# Altium project DanielFairbanksPCB_18_3_6.PrjPcb
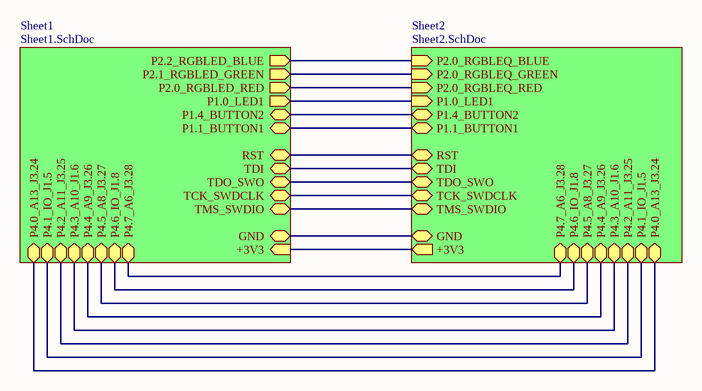
[diagram p0: Sheet3.SchDoc]
3 sheets, 57 parts. Net scope: hierarchical (ports join the sheet entries above them; power ports are global).
Board file: PCB1.PcbDoc
Sheets:
  Sheet3.SchDoc
    Sheet1 = Sheet1.SchDoc
    Sheet2 = Sheet2.SchDoc

## Sheet Sheet3.SchDoc
size A

### Sub-sheets
Sheet1 = Sheet1.SchDoc: +3V3 (in), GND, P1.1_BUTTON1, P1.4_BUTTON2, RST, P1.0_LED1 (out), P2.0_RGBLED_RED (out), P2.2_RGBLED_BLUE (out), P2.1_RGBLED_GREEN (out), TDI, TDO_SWO, TCK_SWDCLK, TMS_SWDIO, P4.1_IO_J1.5, P4.2_A11_J3.25, P4.3_A10_J1.6, P4.4_A9_J3.26, P4.5_A8_J3.27, P4.6_IO_J1.8, P4.0_A13_J3.24, P4.7_A6_J3.28
Sheet2 = Sheet2.SchDoc: +3V3 (out), GND, P1.1_BUTTON1, P1.4_BUTTON2, RST, P1.0_LED1 (in), P2.0_RGBLEQ_RED (in), P2.0_RGBLEQ_GREEN (in), P2.0_RGBLEQ_BLUE (in), TDI, TDO_SWO, TCK_SWDCLK, TMS_SWDIO, P4.0_A13_J3.24, P4.1_IO_J1.5, P4.2_A11_J3.25, P4.3_A10_J1.6, P4.4_A9_J3.26, P4.5_A8_J3.27, P4.6_IO_J1.8, P4.7_A6_J3.28

### Nets
GND: sheet Sheet1/GND, sheet Sheet2/GND
+3V3: sheet Sheet1/+3V3, sheet Sheet2/+3V3
P1.0_LED1: sheet Sheet1/P1.0_LED1, sheet Sheet2/P1.0_LED1
P1.1_BUTTON1: sheet Sheet1/P1.1_BUTTON1, sheet Sheet2/P1.1_BUTTON1
P1.4_BUTTON2: sheet Sheet1/P1.4_BUTTON2, sheet Sheet2/P1.4_BUTTON2
P2.0_RGBLED_RED: sheet Sheet1/P2.0_RGBLED_RED, sheet Sheet2/P2.0_RGBLEQ_RED
P2.0_RGBLEQ_BLUE: sheet Sheet1/P2.2_RGBLED_BLUE, sheet Sheet2/P2.0_RGBLEQ_BLUE
P2.0_RGBLEQ_GREEN: sheet Sheet1/P2.1_RGBLED_GREEN, sheet Sheet2/P2.0_RGBLEQ_GREEN
P4.0_A13_J3.24: sheet Sheet1/P4.0_A13_J3.24, sheet Sheet2/P4.0_A13_J3.24
P4.1_IO_J1.5: sheet Sheet1/P4.1_IO_J1.5, sheet Sheet2/P4.1_IO_J1.5
P4.2_A11_J3.25: sheet Sheet1/P4.2_A11_J3.25, sheet Sheet2/P4.2_A11_J3.25
P4.3_A10_J1.6: sheet Sheet1/P4.3_A10_J1.6, sheet Sheet2/P4.3_A10_J1.6
P4.4_A9_J3.26: sheet Sheet1/P4.4_A9_J3.26, sheet Sheet2/P4.4_A9_J3.26
P4.5_A8_J3.27: sheet Sheet1/P4.5_A8_J3.27, sheet Sheet2/P4.5_A8_J3.27
P4.6_IO_J1.8: sheet Sheet1/P4.6_IO_J1.8, sheet Sheet2/P4.6_IO_J1.8
P4.7_A6_J3.28: sheet Sheet1/P4.7_A6_J3.28, sheet Sheet2/P4.7_A6_J3.28
RST: sheet Sheet1/RST, sheet Sheet2/RST
TDI: sheet Sheet1/TDI, sheet Sheet2/TDI
TDO_SWO: sheet Sheet1/TDO_SWO, sheet Sheet2/TDO_SWO
TMS_SWDIO: sheet Sheet1/TMS_SWDIO, sheet Sheet2/TMS_SWDIO
NetJ10_4: sheet Sheet1/TCK_SWDCLK, sheet Sheet2/TCK_SWDCLK

## Sheet Sheet1.SchDoc
size A
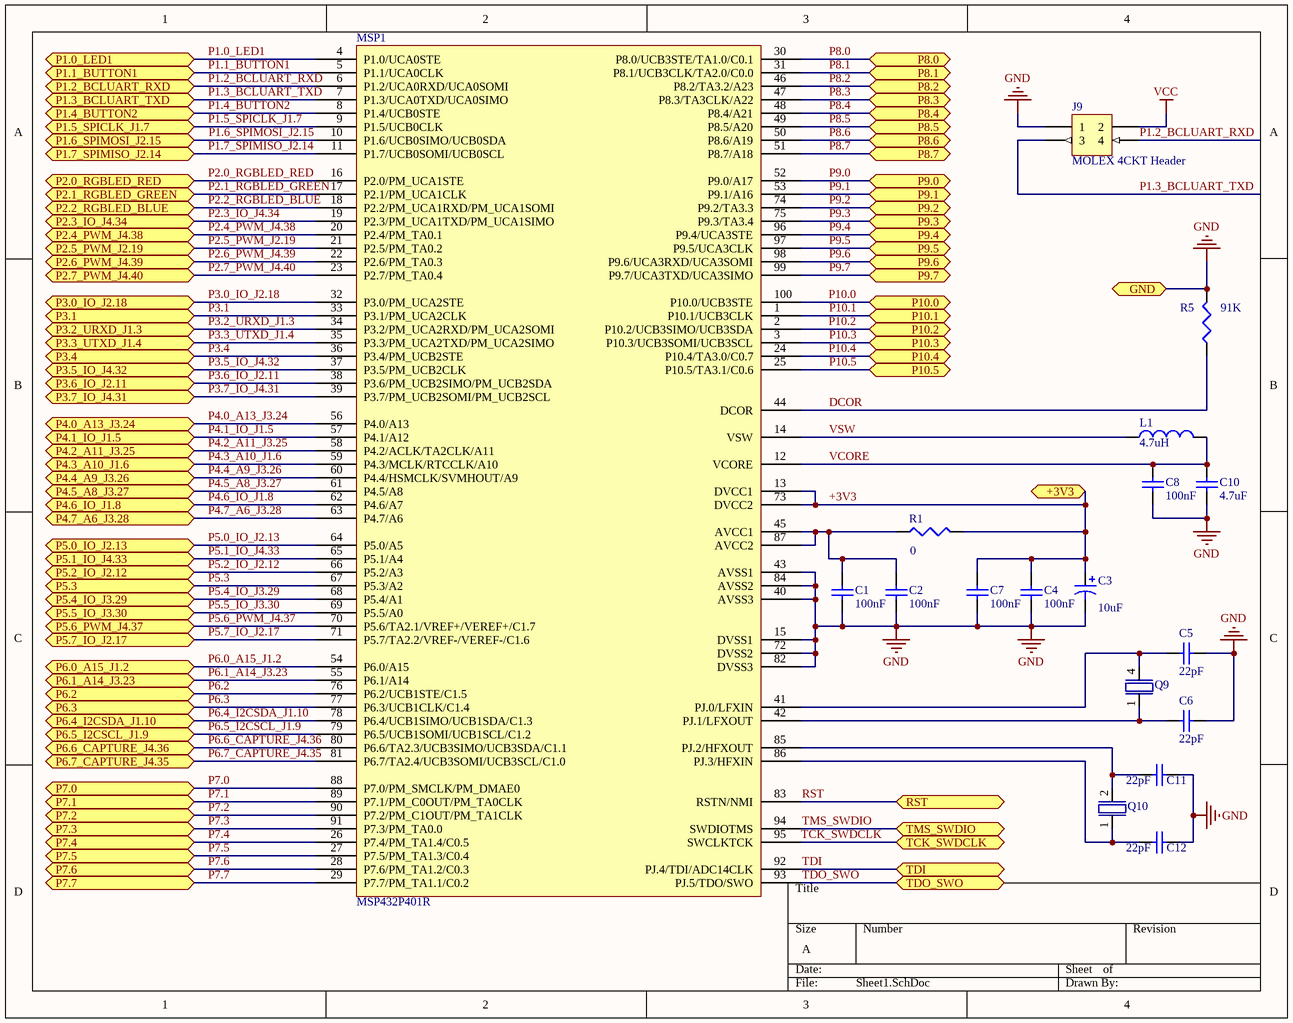
[diagram p1: Sheet1.SchDoc]

### Parts
C1  value 100nF  [0402]  (hidden comment: Cap Semi)
C2  value 100nF  [0402]  (hidden comment: Cap Semi)
C3  value 10uF  [C0805]  (hidden comment: Cap Pol3)
C4  value 100nF  [0402]  (hidden comment: Cap Semi)
C5  value 22pF  [0402]  (hidden comment: Cap Semi)
C6  value 22pF  [0402]  (hidden comment: Cap Semi)
C7  value 100nF  [0402]  (hidden comment: Cap Semi)
C8  value 100nF  [0402]  (hidden comment: Cap Semi)
C10  value 4.7uF  [0402]  (hidden comment: Cap Semi)
C11  value 22pF  [0402]  (hidden comment: Cap Semi)
C12  value 22pF  [0402]  (hidden comment: Cap Semi)
J9  MOLEX 4CKT Header  [MOLEX 4CKT Header]
L1  value 4.7uH  [0402-A]  (hidden comment: Inductor)
MSP1  MSP432P401R  [MSP432P401R]
Q9  Crystal Oscillator  [4-SOJ]  (value not drawn)
Q10  Crystal Oscillator  [HC-49/US]  (value not drawn)
R1  value 0  [J1-0603]  (hidden comment: Res3)
R5  value 91K  [J1-0603]  (hidden comment: Res3)

### Ports
+3V3, GND, P1.0_LED1, P1.1_BUTTON1, P1.2_BCLUART_RXD, P1.3_BCLUART_TXD, P1.4_BUTTON2, P1.5_SPICLK_J1.7, P1.6_SPIMOSI_J2.15, P1.7_SPIMISO_J2.14, P2.0_RGBLED_RED, P2.1_RGBLED_GREEN, P2.2_RGBLED_BLUE, P2.3_IO_J4.34, P2.4_PWM_J4.38, P2.5_PWM_J2.19, P2.6_PWM_J4.39, P2.7_PWM_J4.40, P3.0_IO_J2.18, P3.1, P3.2_URXD_J1.3, P3.3_UTXD_J1.4, P3.4, P3.5_IO_J4.32, P3.6_IO_J2.11, P3.7_IO_J4.31, P4.0_A13_J3.24, P4.1_IO_J1.5, P4.2_A11_J3.25, P4.3_A10_J1.6, P4.4_A9_J3.26, P4.5_A8_J3.27, P4.6_IO_J1.8, P4.7_A6_J3.28, P5.0_IO_J2.13, P5.1_IO_J4.33, P5.2_IO_J2.12, P5.3, P5.4_IO_J3.29, P5.5_IO_J3.30, P5.6_PWM_J4.37, P5.7_IO_J2.17, P6.0_A15_J1.2, P6.1_A14_J3.23, P6.2, P6.3, P6.4_I2CSDA_J1.10, P6.5_I2CSCL_J1.9, P6.6_CAPTURE_J4.36, P6.7_CAPTURE_J4.35, P7.0, P7.1, P7.2, P7.3, P7.4, P7.5, P7.6, P7.7, P8.0, P8.1, P8.2, P8.3, P8.4, P8.5, P8.6, P8.7, P9.0, P9.1, P9.2, P9.3, P9.4, P9.5, P9.6, P9.7, P10.0, P10.1, P10.2, P10.3, P10.4, P10.5, RST, TCK_SWDCLK, TDI, TDO_SWO, TMS_SWDIO

### Nets
GND: C1.1 C2.1 C3.2 C4.1 C5.1 C6.1 C7.1 C8.1 C10.1 C11.1 C12.1 J9.1 MSP1.15(DVSS1) MSP1.40(AVSS3) MSP1.43(AVSS1) MSP1.72(DVSS2) MSP1.82(DVSS3) MSP1.84(AVSS2) R5.2 ; port GND
VCC: J9.2
+3V3: C3.1 C4.2 C7.2 MSP1.13(DVCC1) MSP1.73(DVCC2) R1.2 ; port +3V3
DCOR: MSP1.44(DCOR) R5.1
P1.0_LED1: MSP1.4(P1.0/UCA0STE) ; port P1.0_LED1
P1.1_BUTTON1: MSP1.5(P1.1/UCA0CLK) ; port P1.1_BUTTON1
P1.2_BCLUART_RXD: J9.4 MSP1.6(P1.2/UCA0RXD/UCA0SOMI) ; port P1.2_BCLUART_RXD
P1.3_BCLUART_TXD: J9.3 MSP1.7(P1.3/UCA0TXD/UCA0SIMO) ; port P1.3_BCLUART_TXD
P1.4_BUTTON2: MSP1.8(P1.4/UCB0STE) ; port P1.4_BUTTON2
P1.5_SPICLK_J1.7: MSP1.9(P1.5/UCB0CLK) ; port P1.5_SPICLK_J1.7
P1.6_SPIMOSI_J2.15: MSP1.10(P1.6/UCB0SIMO/UCB0SDA) ; port P1.6_SPIMOSI_J2.15
P1.7_SPIMISO_J2.14: MSP1.11(P1.7/UCB0SOMI/UCB0SCL) ; port P1.7_SPIMISO_J2.14
P2.0_RGBLED_RED: MSP1.16(P2.0/PM_UCA1STE) ; port P2.0_RGBLED_RED
P2.1_RGBLED_GREEN: MSP1.17(P2.1/PM_UCA1CLK) ; port P2.1_RGBLED_GREEN  [project net P2.0_RGBLEQ_GREEN]
P2.2_RGBLED_BLUE: MSP1.18(P2.2/PM_UCA1RXD/PM_UCA1SOMI) ; port P2.2_RGBLED_BLUE  [project net P2.0_RGBLEQ_BLUE]
P2.3_IO_J4.34: MSP1.19(P2.3/PM_UCA1TXD/PM_UCA1SIMO) ; port P2.3_IO_J4.34
P2.4_PWM_J4.38: MSP1.20(P2.4/PM_TA0.1) ; port P2.4_PWM_J4.38
P2.5_PWM_J2.19: MSP1.21(P2.5/PM_TA0.2) ; port P2.5_PWM_J2.19
P2.6_PWM_J4.39: MSP1.22(P2.6/PM_TA0.3) ; port P2.6_PWM_J4.39
P2.7_PWM_J4.40: MSP1.23(P2.7/PM_TA0.4) ; port P2.7_PWM_J4.40
P3.0_IO_J2.18: MSP1.32(P3.0/PM_UCA2STE) ; port P3.0_IO_J2.18
P3.1: MSP1.33(P3.1/PM_UCA2CLK) ; port P3.1
P3.2_URXD_J1.3: MSP1.34(P3.2/PM_UCA2RXD/PM_UCA2SOMI) ; port P3.2_URXD_J1.3
P3.3_UTXD_J1.4: MSP1.35(P3.3/PM_UCA2TXD/PM_UCA2SIMO) ; port P3.3_UTXD_J1.4
P3.4: MSP1.36(P3.4/PM_UCB2STE) ; port P3.4
P3.5_IO_J4.32: MSP1.37(P3.5/PM_UCB2CLK) ; port P3.5_IO_J4.32
P3.6_IO_J2.11: MSP1.38(P3.6/PM_UCB2SIMO/PM_UCB2SDA) ; port P3.6_IO_J2.11
P3.7_IO_J4.31: MSP1.39(P3.7/PM_UCB2SOMI/PM_UCB2SCL) ; port P3.7_IO_J4.31
P4.0_A13_J3.24: MSP1.56(P4.0/A13) ; port P4.0_A13_J3.24
P4.1_IO_J1.5: MSP1.57(P4.1/A12) ; port P4.1_IO_J1.5
P4.2_A11_J3.25: MSP1.58(P4.2/ACLK/TA2CLK/A11) ; port P4.2_A11_J3.25
P4.3_A10_J1.6: MSP1.59(P4.3/MCLK/RTCCLK/A10) ; port P4.3_A10_J1.6
P4.4_A9_J3.26: MSP1.60(P4.4/HSMCLK/SVMHOUT/A9) ; port P4.4_A9_J3.26
P4.5_A8_J3.27: MSP1.61(P4.5/A8) ; port P4.5_A8_J3.27
P4.6_IO_J1.8: MSP1.62(P4.6/A7) ; port P4.6_IO_J1.8
P4.7_A6_J3.28: MSP1.63(P4.7/A6) ; port P4.7_A6_J3.28
P5.0_IO_J2.13: MSP1.64(P5.0/A5) ; port P5.0_IO_J2.13
P5.1_IO_J4.33: MSP1.65(P5.1/A4) ; port P5.1_IO_J4.33
P5.2_IO_J2.12: MSP1.66(P5.2/A3) ; port P5.2_IO_J2.12
P5.3: MSP1.67(P5.3/A2) ; port P5.3
P5.4_IO_J3.29: MSP1.68(P5.4/A1) ; port P5.4_IO_J3.29
P5.5_IO_J3.30: MSP1.69(P5.5/A0) ; port P5.5_IO_J3.30
P5.6_PWM_J4.37: MSP1.70(P5.6/TA2.1/VREF+/VEREF+/C1.7) ; port P5.6_PWM_J4.37
P5.7_IO_J2.17: MSP1.71(P5.7/TA2.2/VREF-/VEREF-/C1.6) ; port P5.7_IO_J2.17
P6.0_A15_J1.2: MSP1.54(P6.0/A15) ; port P6.0_A15_J1.2
P6.1_A14_J3.23: MSP1.55(P6.1/A14) ; port P6.1_A14_J3.23
P6.2: MSP1.76(P6.2/UCB1STE/C1.5) ; port P6.2
P6.3: MSP1.77(P6.3/UCB1CLK/C1.4) ; port P6.3
P6.4_I2CSDA_J1.10: MSP1.78(P6.4/UCB1SIMO/UCB1SDA/C1.3) ; port P6.4_I2CSDA_J1.10
P6.5_I2CSCL_J1.9: MSP1.79(P6.5/UCB1SOMI/UCB1SCL/C1.2) ; port P6.5_I2CSCL_J1.9
P6.6_CAPTURE_J4.36: MSP1.80(P6.6/TA2.3/UCB3SIMO/UCB3SDA/C1.1) ; port P6.6_CAPTURE_J4.36
P6.7_CAPTURE_J4.35: MSP1.81(P6.7/TA2.4/UCB3SOMI/UCB3SCL/C1.0) ; port P6.7_CAPTURE_J4.35
P7.0: MSP1.88(P7.0/PM_SMCLK/PM_DMAE0) ; port P7.0
P7.1: MSP1.89(P7.1/PM_C0OUT/PM_TA0CLK) ; port P7.1
P7.2: MSP1.90(P7.2/PM_C1OUT/PM_TA1CLK) ; port P7.2
P7.3: MSP1.91(P7.3/PM_TA0.0) ; port P7.3
P7.4: MSP1.26(P7.4/PM_TA1.4/C0.5) ; port P7.4
P7.5: MSP1.27(P7.5/PM_TA1.3/C0.4) ; port P7.5
P7.6: MSP1.28(P7.6/PM_TA1.2/C0.3) ; port P7.6
P7.7: MSP1.29(P7.7/PM_TA1.1/C0.2) ; port P7.7
P8.0: MSP1.30(P8.0/UCB3STE/TA1.0/C0.1) ; port P8.0
P8.1: MSP1.31(P8.1/UCB3CLK/TA2.0/C0.0) ; port P8.1
P8.2: MSP1.46(P8.2/TA3.2/A23) ; port P8.2
P8.3: MSP1.47(P8.3/TA3CLK/A22) ; port P8.3
P8.4: MSP1.48(P8.4/A21) ; port P8.4
P8.5: MSP1.49(P8.5/A20) ; port P8.5
P8.6: MSP1.50(P8.6/A19) ; port P8.6
P8.7: MSP1.51(P8.7/A18) ; port P8.7
P9.0: MSP1.52(P9.0/A17) ; port P9.0
P9.1: MSP1.53(P9.1/A16) ; port P9.1
P9.2: MSP1.74(P9.2/TA3.3) ; port P9.2
P9.3: MSP1.75(P9.3/TA3.4) ; port P9.3
P9.4: MSP1.96(P9.4/UCA3STE) ; port P9.4
P9.5: MSP1.97(P9.5/UCA3CLK) ; port P9.5
P9.6: MSP1.98(P9.6/UCA3RXD/UCA3SOMI) ; port P9.6
P9.7: MSP1.99(P9.7/UCA3TXD/UCA3SIMO) ; port P9.7
P10.0: MSP1.100(P10.0/UCB3STE) ; port P10.0
P10.1: MSP1.1(P10.1/UCB3CLK) ; port P10.1
P10.2: MSP1.2(P10.2/UCB3SIMO/UCB3SDA) ; port P10.2
P10.3: MSP1.3(P10.3/UCB3SOMI/UCB3SCL) ; port P10.3
P10.4: MSP1.24(P10.4/TA3.0/C0.7) ; port P10.4
P10.5: MSP1.25(P10.5/TA3.1/C0.6) ; port P10.5
RST: MSP1.83(RSTN/NMI) ; port RST
TDI: MSP1.92(PJ.4/TDI/ADC14CLK) ; port TDI
TDO_SWO: MSP1.93(PJ.5/TDO/SWO) ; port TDO_SWO
TMS_SWDIO: MSP1.94(SWDIOTMS) ; port TMS_SWDIO
VCORE: C8.2 C10.2 L1.2 MSP1.12(VCORE)
VSW: L1.1 MSP1.14(VSW)
NetC1_2: C1.2 C2.2 MSP1.45(AVCC1) MSP1.87(AVCC2) R1.1
NetC5_2: C5.2 MSP1.41(PJ.0/LFXIN) Q9.4
NetC6_2: C6.2 MSP1.42(PJ.1/LFXOUT) Q9.1
NetC11_2: C11.2 MSP1.85(PJ.2/HFXOUT) Q10.2
NetC12_2: C12.2 MSP1.86(PJ.3/HFXIN) Q10.1
NetJ10_4: MSP1.95(SWCLKTCK) ; port TCK_SWDCLK

### Notes on the sheet
- Labels drawn without touching a wire or pin: TCK_SWDCLK

### Library data of the parts
C1 C2 C4-C8 C10-C12 = Cap Semi: Capacitor (Semiconductor SIM Model); Published: 8-Jun-2000; LatestRevisionDate: 29-May-2009; LatestRevisionNote: IPC-7351 Footprint Added.; PackageReference: C1206; Publisher: Altium Limited; PackageDescription: Chip Capacitor
C3 = Cap Pol3: Polarized Capacitor (Surface Mount); Published: 8-Jun-2000; LatestRevisionDate: 29-May-2009; LatestRevisionNote: IPC-7351 Footprint Added.; PackageReference: C0805; Publisher: Altium Limited; PackageDescription: Chip Capacitor
L1 = Inductor: Code_IEC: 1005; Published: 8-Jun-2000; LatestRevisionDate: 29-May-2009; LatestRevisionNote: IPC-7351 Footprint Added.; PackageReference: 0402-A; Publisher: Altium Limited; PackageDescription: Chip Inductor; Code_JEITA: 0402
R1 R5 = Res3: Resistor; Published: 8-Jun-2000; LatestRevisionDate: 29-May-2009; LatestRevisionNote: IPC-7351 Footprint Added.; PackageReference: J1-0603; Publisher: Altium Limited; PackageDescription: Chip Resistor

## Sheet Sheet2.SchDoc
size A
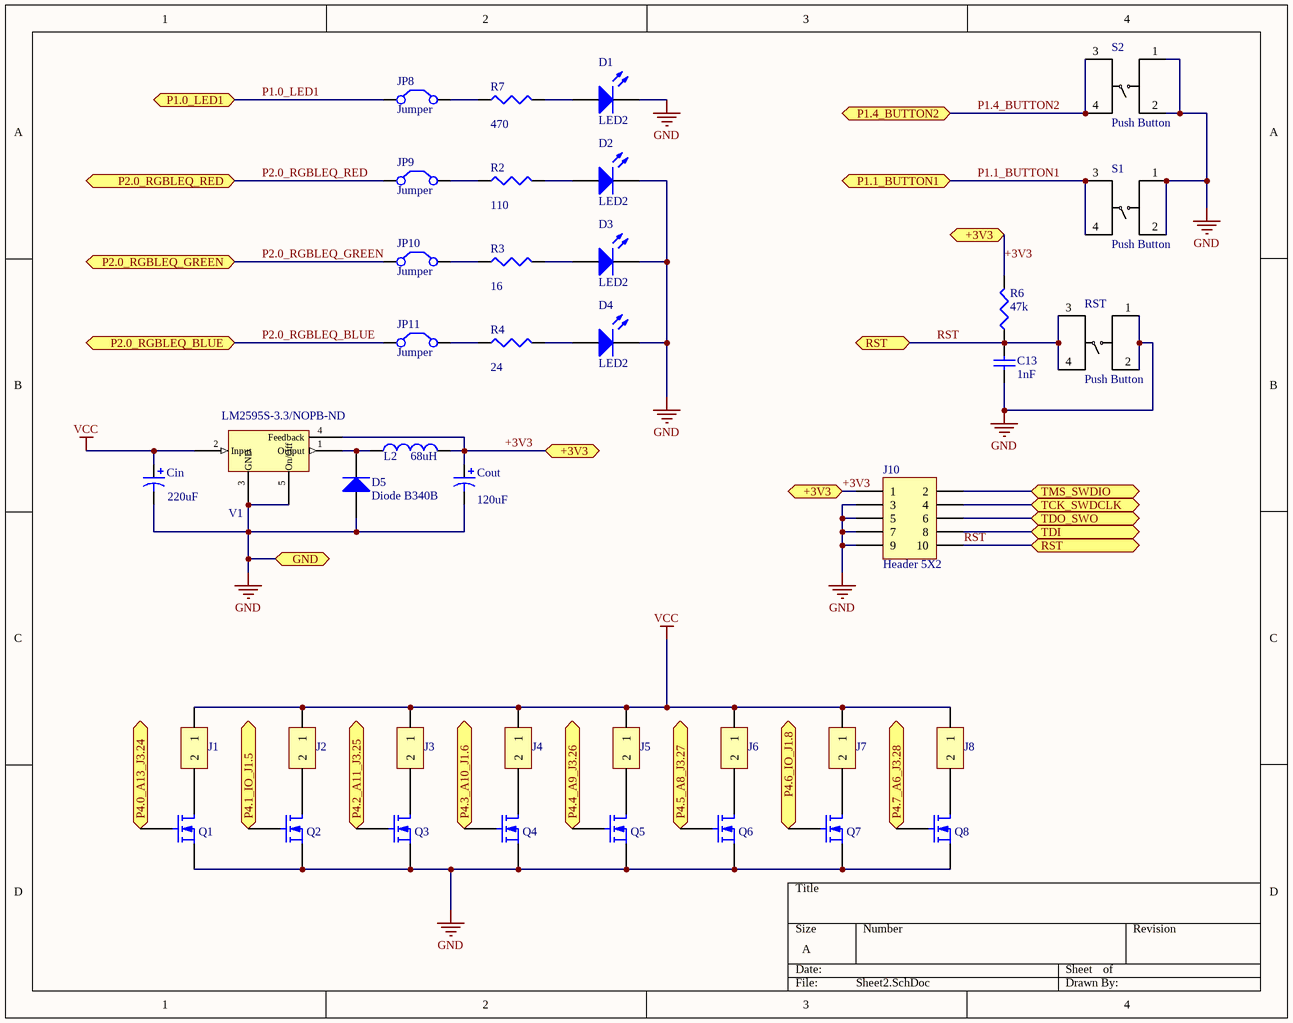
[diagram p2: Sheet2.SchDoc]

### Parts
C13  value 1nF  [0402]  (hidden comment: Cap Semi)
Cin  value 220uF  [C0805]  (hidden comment: Cap Pol3)
Cout  value 120uF  [C0805]  (hidden comment: Cap Pol3)
D1  LED2  [3.2X1.6X1.1]
D2  LED2  [3.2X1.6X1.1]
D3  LED2  [3.2X1.6X1.1]
D4  LED2  [3.2X1.6X1.1]
D5  Diode B340B  [SMB]
J1  MOLEX 2CKT Header  [MOLEX 2CKT Header]  (value not drawn)
J2  MOLEX 2CKT Header  [MOLEX 2CKT Header]  (value not drawn)
J3  MOLEX 2CKT Header  [MOLEX 2CKT Header]  (value not drawn)
J4  MOLEX 2CKT Header  [MOLEX 2CKT Header]  (value not drawn)
J5  MOLEX 2CKT Header  [MOLEX 2CKT Header]  (value not drawn)
J6  MOLEX 2CKT Header  [MOLEX 2CKT Header]  (value not drawn)
J7  MOLEX 2CKT Header  [MOLEX 2CKT Header]  (value not drawn)
J8  MOLEX 2CKT Header  [MOLEX 2CKT Header]  (value not drawn)
J10  Header 5X2  [HDR2X5]
JP8  Jumper  [HDR1X2]
JP9  Jumper  [HDR1X2]
JP10  Jumper  [HDR1X2]
JP11  Jumper  [HDR1X2]
L2  value 68uH  [0402-A]  (hidden comment: Inductor)
Q1  MOSFET-N  [SiUD41ED]  (value not drawn)
Q2  MOSFET-N  [SiUD41ED]  (value not drawn)
Q3  MOSFET-N  [SiUD41ED]  (value not drawn)
Q4  MOSFET-N  [SiUD41ED]  (value not drawn)
Q5  MOSFET-N  [SiUD41ED]  (value not drawn)
Q6  MOSFET-N  [SiUD41ED]  (value not drawn)
Q7  MOSFET-N  [SiUD41ED]  (value not drawn)
Q8  MOSFET-N  [SiUD41ED]  (value not drawn)
R2  value 110  [J1-0603]  (hidden comment: Res3)
R3  value 16  [J1-0603]  (hidden comment: Res3)
R4  value 24  [J1-0603]  (hidden comment: Res3)
R6  value 47k  [J1-0603]  (hidden comment: Res3)
R7  value 470  [J1-0603]  (hidden comment: Res3)
RST  Push Button  [Push Button]
S1  Push Button  [Push Button]
S2  Push Button  [Push Button]
V1  LM2595S-3.3/NOPB-ND  [LM2595S-3.3/NOPB-ND]

### Ports
+3V3, GND, P1.0_LED1, P1.1_BUTTON1, P1.4_BUTTON2, P2.0_RGBLEQ_BLUE, P2.0_RGBLEQ_GREEN, P2.0_RGBLEQ_RED, P4.0_A13_J3.24, P4.1_IO_J1.5, P4.2_A11_J3.25, P4.3_A10_J1.6, P4.4_A9_J3.26, P4.5_A8_J3.27, P4.6_IO_J1.8, P4.7_A6_J3.28, RST, TCK_SWDCLK, TDI, TDO_SWO, TMS_SWDIO

### Nets
GND: C13.1 Cin.2 Cout.2 D1.2(K) D2.2(K) D3.2(K) D4.2(K) D5.1(A) J10.3 J10.5 J10.7 J10.9 Q1.2 Q2.2 Q3.2 Q4.2 Q5.2 Q6.2 Q7.2 Q8.2 RST.1 RST.2 S1.1 S1.2 S2.1 S2.2 V1.3(GND) V1.5(On/Off) ; port GND
VCC: Cin.1 J1.1 J2.1 J3.1 J4.1 J5.1 J6.1 J7.1 J8.1 V1.2(Input)
+3V3: Cout.1 J10.1 L2.2 R6.2 V1.4(Feedback) ; port +3V3
P1.0_LED1: JP8.1(C1) ; port P1.0_LED1
P1.1_BUTTON1: S1.3 S1.4 ; port P1.1_BUTTON1
P1.4_BUTTON2: S2.3 S2.4 ; port P1.4_BUTTON2
P2.0_RGBLEQ_BLUE: JP11.1(C1) ; port P2.0_RGBLEQ_BLUE
P2.0_RGBLEQ_GREEN: JP10.1(C1) ; port P2.0_RGBLEQ_GREEN
P2.0_RGBLEQ_RED: JP9.1(C1) ; port P2.0_RGBLEQ_RED  [project net P2.0_RGBLED_RED]
P4.0_A13_J3.24: Q1.1 ; port P4.0_A13_J3.24
P4.1_IO_J1.5: Q2.1 ; port P4.1_IO_J1.5
P4.2_A11_J3.25: Q3.1 ; port P4.2_A11_J3.25
P4.3_A10_J1.6: Q4.1 ; port P4.3_A10_J1.6
P4.4_A9_J3.26: Q5.1 ; port P4.4_A9_J3.26
P4.5_A8_J3.27: Q6.1 ; port P4.5_A8_J3.27
P4.6_IO_J1.8: Q7.1 ; port P4.6_IO_J1.8
P4.7_A6_J3.28: Q8.1 ; port P4.7_A6_J3.28
RST: C13.2 J10.10 R6.1 RST.3 RST.4 ; port RST
TDI: J10.8 ; port TDI
TDO_SWO: J10.6 ; port TDO_SWO
TMS_SWDIO: J10.2 ; port TMS_SWDIO
NetD1_1: D1.1(A) R7.2
NetD2_1: D2.1(A) R2.2
NetD3_1: D3.1(A) R3.2
NetD4_1: D4.1(A) R4.2
NetD5_2: D5.2(K) L2.1 V1.1(Output)
NetJ1_2: J1.2 Q1.3
NetJ2_2: J2.2 Q2.3
NetJ3_2: J3.2 Q3.3
NetJ4_2: J4.2 Q4.3
NetJ5_2: J5.2 Q5.3
NetJ6_2: J6.2 Q6.3
NetJ7_2: J7.2 Q7.3
NetJ8_2: J8.2 Q8.3
NetJ10_4: J10.4 ; port TCK_SWDCLK
NetJP8_2: JP8.2(C2) R7.1
NetJP9_2: JP9.2(C2) R2.1
NetJP10_2: JP10.2(C2) R3.1
NetJP11_2: JP11.2(C2) R4.1

### Library data of the parts
C13 = Cap Semi: Capacitor (Semiconductor SIM Model); Published: 8-Jun-2000; LatestRevisionDate: 29-May-2009; LatestRevisionNote: IPC-7351 Footprint Added.; PackageReference: C1206; Publisher: Altium Limited; PackageDescription: Chip Capacitor
Cin Cout = Cap Pol3: Polarized Capacitor (Surface Mount); Published: 8-Jun-2000; LatestRevisionDate: 29-May-2009; LatestRevisionNote: IPC-7351 Footprint Added.; PackageReference: C0805; Publisher: Altium Limited; PackageDescription: Chip Capacitor
D1-D4 = LED2: Typical RED, GREEN, YELLOW, AMBER GaAs LED; Published: 8-Jun-2000; LatestRevisionDate: 17-Jul-2002; LatestRevisionNote: Re-released for DXP Platform.; PackageVersion: Feb-2002; PackageReference: 3.2X1.6X1.1; Publisher: Altium Limited; PackageDescription: SM LED; 2 Flat Leads
D5 = Diode: Default Diode; Published: 8-Jun-2000; LatestRevisionDate: 17-Jul-2002; LatestRevisionNote: Re-released for DXP Platform.; PackageVersion: Sep-1996; PackageReference: SMC; Publisher: Altium Limited; PackageDescription: DO-214-AB/SMC; 2 C-Bend Leads; Body 7.9 x 5.9 mm, inc. leads (LxW); Code_JEDEC: DO-214-AB
J10 = Header 5X2: Header, 5-Pin, Dual row; LatestRevisionDate: 17-Jul-2002; LatestRevisionNote: Re-released for DXP Platform.; Publisher: Altium Limited
JP8-JP11 = Jumper: Jumper Wire; Published: 24-Mar-1999; LatestRevisionDate: 17-Jul-2002; LatestRevisionNote: Re-released for DXP Platform.; PackageReference: RAD-0.2; Publisher: Altium Limited; PackageDescription: Radial Cap, Thru-Hole; 2 Leads; 0.2 in Pin Spacing
L2 = Inductor: Code_IEC: 1005; Published: 8-Jun-2000; LatestRevisionDate: 29-May-2009; LatestRevisionNote: IPC-7351 Footprint Added.; PackageReference: 0402-A; Publisher: Altium Limited; PackageDescription: Chip Inductor; Code_JEITA: 0402
Q1-Q8 = SiUD41ED
R2-R4 R6 R7 = Res3: Resistor; Published: 8-Jun-2000; LatestRevisionDate: 29-May-2009; LatestRevisionNote: IPC-7351 Footprint Added.; PackageReference: J1-0603; Publisher: Altium Limited; PackageDescription: Chip Resistor

## Nets that join several sheets
GND: Sheet1 (19 pins), Sheet2 (28 pins)
VCC: Sheet1 (J9.2), Sheet2 (10 pins)
+3V3: Sheet1 (6 pins), Sheet2 (5 pins)
NetJ10_4: Sheet1 (MSP1.95), Sheet2 (J10.4)
P1.0_LED1: Sheet1 (MSP1.4), Sheet2 (JP8.1)
P1.1_BUTTON1: Sheet1 (MSP1.5), Sheet2 (S1.3 S1.4)
P1.4_BUTTON2: Sheet1 (MSP1.8), Sheet2 (S2.3 S2.4)
P2.0_RGBLED_RED: Sheet1 (MSP1.16), Sheet2 (JP9.1)
P2.0_RGBLEQ_BLUE: Sheet1 (MSP1.18), Sheet2 (JP11.1)
P2.0_RGBLEQ_GREEN: Sheet1 (MSP1.17), Sheet2 (JP10.1)
P4.0_A13_J3.24: Sheet1 (MSP1.56), Sheet2 (Q1.1)
P4.1_IO_J1.5: Sheet1 (MSP1.57), Sheet2 (Q2.1)
P4.2_A11_J3.25: Sheet1 (MSP1.58), Sheet2 (Q3.1)
P4.3_A10_J1.6: Sheet1 (MSP1.59), Sheet2 (Q4.1)
P4.4_A9_J3.26: Sheet1 (MSP1.60), Sheet2 (Q5.1)
P4.5_A8_J3.27: Sheet1 (MSP1.61), Sheet2 (Q6.1)
P4.6_IO_J1.8: Sheet1 (MSP1.62), Sheet2 (Q7.1)
P4.7_A6_J3.28: Sheet1 (MSP1.63), Sheet2 (Q8.1)
RST: Sheet1 (MSP1.83), Sheet2 (5 pins)
TDI: Sheet1 (MSP1.92), Sheet2 (J10.8)
TDO_SWO: Sheet1 (MSP1.93), Sheet2 (J10.6)
TMS_SWDIO: Sheet1 (MSP1.94), Sheet2 (J10.2)